# Altium schematic sheet 09 Audio.SchDoc
size A4; Revision: V1.2; SheetNumber: 9; SheetTotal: 11
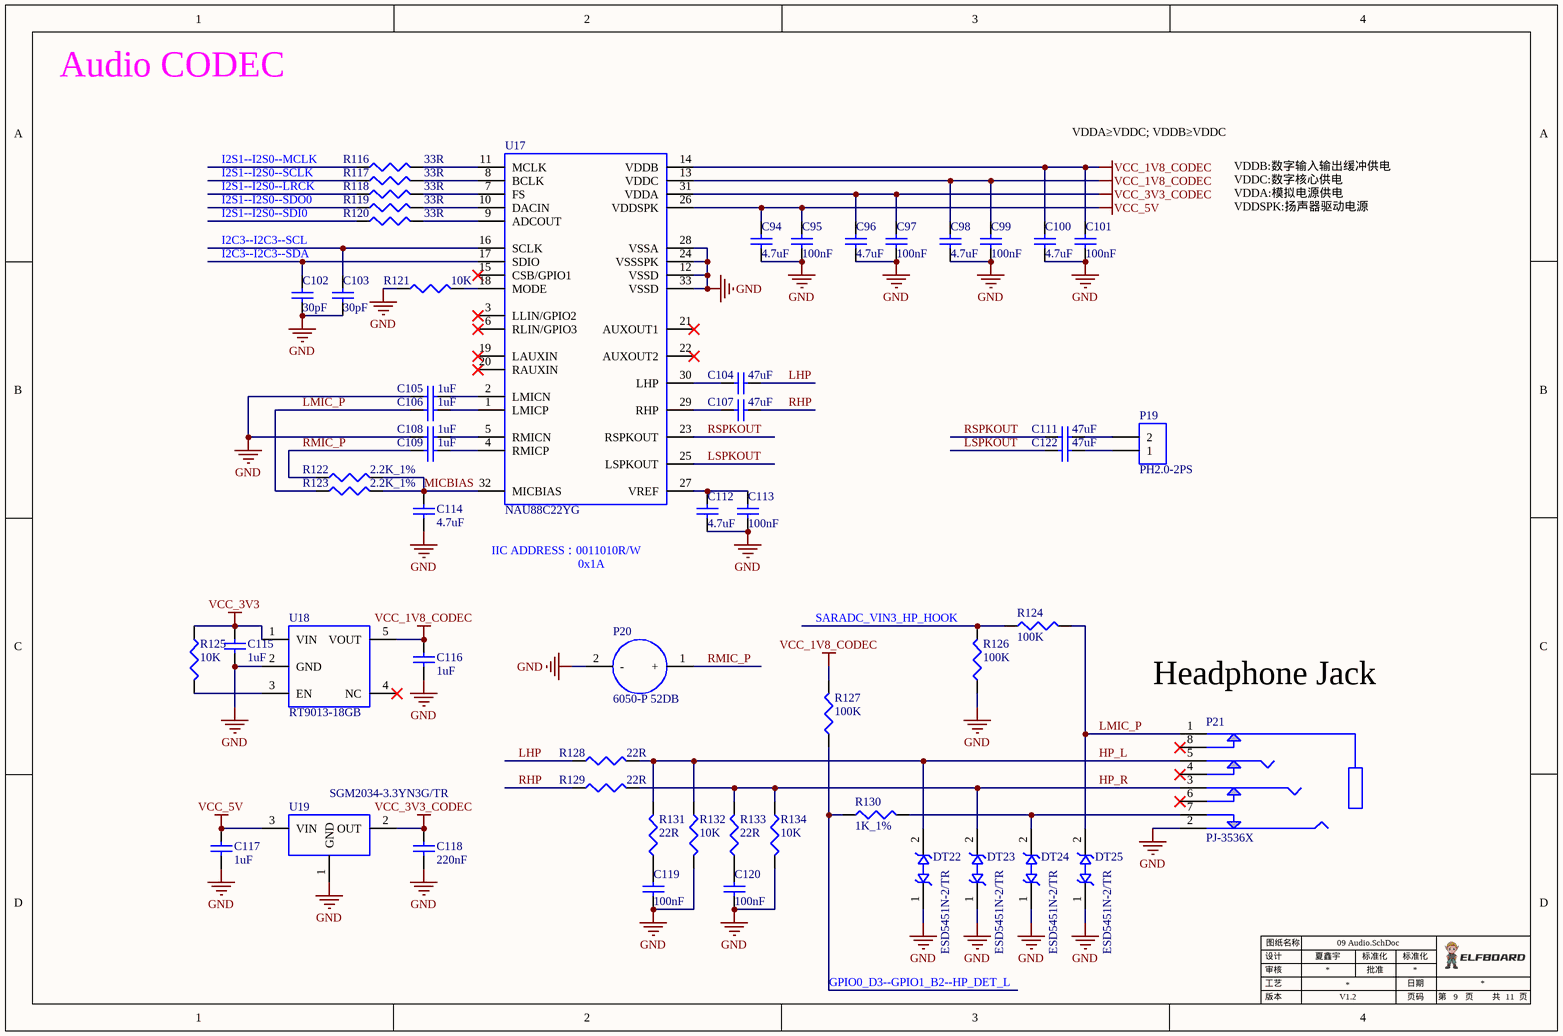
[diagram p0: 09 Audio.SchDoc]

## Parts
C94  4.7uF  [0402C]
C95  100nF  [0402C]
C96  4.7uF  [0402C]
C97  100nF  [0402C]
C98  4.7uF  [0402C]
C99  100nF  [0402C]
C100  4.7uF  [0402C]
C101  100nF  [0402C]
C102  30pF  [0402C]
C103  30pF  [0402C]
C104  47uF  [0805C]
C105  1uF  [0402C]
C106  1uF  [0402C]
C107  47uF  [0805C]
C108  1uF  [0402C]
C109  1uF  [0402C]
C111  47uF  [0805C]
C112  4.7uF  [0402C]
C113  100nF  [0402C]
C114  4.7uF  [0402C]
C115  1uF  [0402C]
C116  1uF  [0402C]
C117  1uF  [0402C]
C118  220nF  [0402C]
C119  100nF  [0402C]
C120  100nF  [0402C]
C122  47uF  [0805C]
DT22  ESD5451N-2/TR  [0402TVS]
DT23  ESD5451N-2/TR  [0402TVS]
DT24  ESD5451N-2/TR  [0402TVS]
DT25  ESD5451N-2/TR  [0402TVS]
P19  PH2.0-2PS  [PH2.0_2P_V]
P20  6050-P 52DB  [MIC 2*5]
P21  PJ-3536X  [PJ3930-8P]
R116  33R  [0402R]
R117  33R  [0402R]
R118  33R  [0402R]
R119  33R  [0402R]
R120  33R  [0402R]
R121  10K  [0402R]
R122  2.2K_1%  [0402R]
R123  2.2K_1%  [0402R]
R124  100K  [0402R]
R125  10K  [0402R]
R126  100K  [0402R]
R127  100K  [0402R]
R128  22R  [0402R]
R129  22R  [0402R]
R130  1K_1%  [0402R]
R131  22R  [0402R]
R132  10K  [0402R]
R133  22R  [0402R]
R134  10K  [0402R]
U17  NAU88C22YG  [QFN32P_0.5BSC_5*5_H_3..65*3.65]
U18  RT9013-18GB  [SOT_235]
U19  SGM2034-3.3YN3G/TR  [SOT_233_N]

## Nets
GND: C94.1 C95.1 C96.1 C97.1 C98.1 C99.1 C100.1 C101.1 C102.1 C103.1 C105.1 C108.1 C112.1 C113.1 C114.1 C115.1 C116.1 C117.1 C118.1 C119.1 C120.1 DT22.1 DT23.1 DT24.1 DT25.1 P20.2(-) P21.2 R121.1 R126.1 R132.2 R134.2 U17.12(VSSD) U17.24(VSSSPK) U17.28(VSSA) U17.33(VSSD) U18.2(GND) U19.1(GND)
VCC_1V8_CODEC: C98.2 C99.2 C100.2 C101.2 C116.2 R127.2 U17.13(VDDC) U17.14(VDDB) U18.5(VOUT)
VCC_3V3: C115.2 R125.1 U18.1(VIN)
VCC_3V3_CODEC: C96.2 C97.2 C118.2 U17.31(VDDA) U19.2(OUT)
VCC_5V: C94.2 C95.2 C117.2 U17.26(VDDSPK) U19.3(VIN)
GPIO0_D3--GPIO1_B2--HP_DET_L: R127.1 R130.1
HP_L: DT22.2 P21.5 R128.2 R131.2 R132.1
HP_R: DT23.2 P21.3 R129.2 R133.2 R134.1
I2C3--I2C3--SCL: C103.2 U17.16(SCLK)
I2C3--I2C3--SDA: C102.2 U17.17(SDIO)
I2S1--I2S0--LRCK: R118.1
I2S1--I2S0--MCLK: R116.1
I2S1--I2S0--SCLK: R117.1
I2S1--I2S0--SDI0: R120.1
I2S1--I2S0--SDO0: R119.1
LHP: C104.2 R128.1
LMIC_P: C106.1 DT25.2 P21.1 R123.1 R124.2
LSPKOUT: C122.1 U17.25(LSPKOUT)
MICBIAS: C114.2 R122.2 R123.2 U17.32(MICBIAS)
RHP: C107.2 R129.1
RMIC_P: C109.1 P20.1(+) R122.1
RSPKOUT: C111.1 U17.23(RSPKOUT)
SARADC_VIN3_HP_HOOK: R124.1 R126.2
NetC104_1: C104.1 U17.30(LHP)
NetC105_2: C105.2 U17.2(LMICN)
NetC106_2: C106.2 U17.1(LMICP)
NetC107_1: C107.1 U17.29(RHP)
NetC108_2: C108.2 U17.5(RMICN)
NetC109_2: C109.2 U17.4(RMICP)
NetC111_2: C111.2 P19.2
NetC112_2: C112.2 C113.2 U17.27(VREF)
NetC119_2: C119.2 R131.1
NetC120_2: C120.2 R133.1
NetC122_2: C122.2 P19.1
NetDT24_2: DT24.2 P21.7 R130.2
NetR116_2: R116.2 U17.11(MCLK)
NetR117_2: R117.2 U17.8(BCLK)
NetR118_2: R118.2 U17.7(FS)
NetR119_2: R119.2 U17.10(DACIN)
NetR120_2: R120.2 U17.9(ADCOUT)
NetR121_2: R121.2 U17.18(MODE)
NetR125_2: R125.2 U18.3(EN)

Not connected (* = marked no-connect by the designer): P21 4* 6* 8*; U17 3(LLIN/GPIO2)* 6(RLIN/GPIO3)* 15(CSB/GPIO1)* 19(LAUXIN)* 20(RAUXIN)* 21(AUXOUT1)* 22(AUXOUT2)*; U18 4(NC)*

## Notes on the sheet
- Audio CODEC
- VDDA≥VDDC; VDDB≥VDDC
- VDDB:数字输入输出缓冲供电
- VDDC:数字核心供电
- VDDA:模拟电源供电
- VDDSPK:扬声器驱动电源
- IIC ADDRESS：0011010R/W
- 0x1A
- (near P21) Headphone Jack
- 设计
- 审核
- 工艺
- 图纸名称
- 夏鑫宇
- 批准
- 标准化
- 日期
- 版本
- 页码
- 第
- 页
- 共

## Library data of the parts
C94 C96 C98 C100 C112 C114 = 1110202032: 序号: 616; 存货名称: 贴装叠层陶瓷电容; 规格型号: 0402,4.7uF,10V,±10％,X5R; Published: 8-Jun-2000; LatestRevisionDate: 17-Jul-2002; LatestRevisionNote: Re-released for DXP Platform.; PackageReference: RAD-0.3; Publisher: Altium Limited; PackageDescription: Radial Cap, Thru-Hole; 2 Leads; 0.3 in Pin Spacing; Value: 4.7uF; 存货编码: 1110202032
C95 C97 C99 C101 C113 C119 C120 = 1110202039: 序号: 626; 存货名称: 贴装叠层陶瓷电容; 规格型号: 0402,100nF,25V,±10％,X5R; Published: 8-Jun-2000; LatestRevisionDate: 17-Jul-2002; LatestRevisionNote: Re-released for DXP Platform.; PackageReference: RAD-0.3; Publisher: Altium Limited; PackageDescription: Radial Cap, Thru-Hole; 2 Leads; 0.3 in Pin Spacing; Value: 100nF; 存货编码: 1110202039
C102 C103 = 1110202045: 存货名称: 贴装叠层陶瓷电容; 规格型号: 0402,30pF,50V,±5%,NPO; Published: 8-Jun-2000; LatestRevisionDate: 17-Jul-2002; LatestRevisionNote: Re-released for DXP Platform.; PackageReference: RAD-0.3; Publisher: Altium Limited; PackageDescription: Radial Cap, Thru-Hole; 2 Leads; 0.3 in Pin Spacing; Value: 30pF; 存货编码: 1110202045
C104 C107 C111 C122 = 1110204008: 序号: 711; 存货名称: 贴装叠层陶瓷电容; 规格型号: 0805,47uF,6.3V,±20％,X5R; 禁用: #REF!; 近三年购买频次（更新至2023/12/7）: 近三年购买频次,41; Published: 8-Jun-2000; LatestRevisionDate: 17-Jul-2002; LatestRevisionNote: Re-released for DXP Platform.; PackageReference: RAD-0.3; Publisher: Altium Limited; PackageDescription: Radial Cap, Thru-Hole; 2 Leads; 0.3 in Pin Spacing; Value: 47uF; 存货编码: 1110204008; 最近一次购买记录(更新至20231207）: 2023/11/15; 料号建立日期: 2019/7/2
C105 C106 C108 C109 C115-C117 = 1110202021: 序号: 600; 存货名称: 贴装叠层陶瓷电容; 规格型号: 0402,1uF,16V,±10％,X5R; Published: 8-Jun-2000; LatestRevisionDate: 17-Jul-2002; LatestRevisionNote: Re-released for DXP Platform.; PackageReference: RAD-0.3; Publisher: Altium Limited; PackageDescription: Radial Cap, Thru-Hole; 2 Leads; 0.3 in Pin Spacing; Value: 1uF; 存货编码: 1110202021
C118 = 1110202042: 存货名称: 贴装叠层陶瓷电容; 规格型号: 0402,220nF,25V,±10％,X5R; Published: 8-Jun-2000; LatestRevisionDate: 17-Jul-2002; LatestRevisionNote: Re-released for DXP Platform.; PackageReference: RAD-0.3; Publisher: Altium Limited; PackageDescription: Radial Cap, Thru-Hole; 2 Leads; 0.3 in Pin Spacing; Value: 220nF; 存货编码: 1110202042
DT22-DT25 = 1110503036: 存货名称: TVS管; 规格型号: ESD5451N-2/TR,DFN1006-2L; Value: ESD5451N-2/TR; 存货编码: 1110503036
P19 = 1120201007: 序号: 1261; 存货名称: 插装连接器; 规格型号: PH,公头,2P,2.0mm,S; LatestRevisionDate: 17-Jul-2002; LatestRevisionNote: Re-released for DXP Platform.; Publisher: Altium Limited; Value: PH2.0-2PS; 存货编码: 1120201007
P20 = 1120202094: 序号: 4063; 存货名称: 话筒; 规格型号: 6050-P 52DB 带引脚; 描述栏信息: 咪头; 存货编码: 1120202094; Value: 6050-P 52DB
P21 = 1120102026: 3.5mm音频4级耳机插座，SMT贴片黑色; 序号: 2191; 存货名称: 贴装音频座; 规格型号: PJ3930-8P,3.5mm,4级; 禁用状态: 否; Value: PJ-3536X; 存货编码: 1120102026
R116-R120 = 1110102027: 序号: 38; 存货名称: 贴装电阻; 规格型号: 0402,33Ω,±5％; Value: 33R; 存货编码: 1110102027
R121 R125 R132 R134 = 1110102007: 序号: 17; 存货名称: 贴装电阻; 规格型号: 0402,10K,±5％; Value: 10K; 存货编码: 1110102007
R122 R123 = 1110102038: 序号: 51; 存货名称: 贴装电阻; 规格型号: 0402,2.2K,±1％; Value: 2.2K_1%; 存货编码: 1110102038
R124 R126 R127 = 1110102004: 序号: 14; 存货名称: 贴装电阻; 规格型号: 0402,100K,±5％; Value: 100K; 存货编码: 1110102004
R128 R129 R131 R133 = 1110102028: 序号: 41; 存货名称: 贴装电阻; 规格型号: 0402,22Ω,±5％; Value: 22R; 存货编码: 1110102028
R130 = 1110102011: 序号: 21; 存货名称: 贴装电阻; 规格型号: 0402,1K,±1％; Value: 1K_1%; 存货编码: 1110102011
U17 = 1110405394: 存货名称: 常规IC; 规格型号: NAU88C22YG,QFN32; value: NAU88C22YG; 存货编码: 1110405394
U18 = 1110404097: 序号: 2093; 存货名称: 电源; 规格型号: RT9013-18GB,SOT-23-5; Value: RT9013-18GB; 存货编码: 1110404097
U19 = 1110404126: 存货名称: 电源; 规格型号: SGM2034-3.3YN3G/TR,SOT-23-3; 描述栏信息: 替代1110404068，备件为1110404151; 存货编码: 1110404126; Value: SGM2034-3.3YN3G/TR